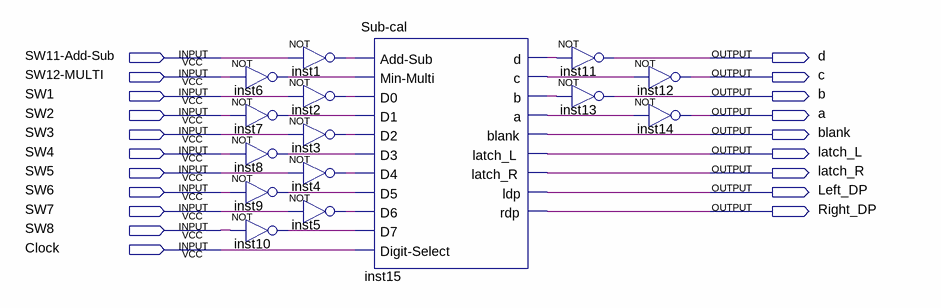
[diagram p0: schematic sheet]
// Quartus schematic Calculator.bdf as structural Verilog: 15 symbols, 20 pins
module Calculator (
  input  \SW11-Add-Sub ,
  input  \SW12-MULTI ,
  input  SW1,
  input  SW2,
  input  SW3,
  input  SW4,
  input  SW5,
  input  SW6,
  input  SW7,
  input  SW8,
  input  Clock,
  output d,
  output c,
  output b,
  output a,
  output blank,
  output latch_L,
  output latch_R,
  output Left_DP,
  output Right_DP
);

  wire inst1_out, inst2_out, inst3_out, inst4_out, inst5_out, inst6_out, inst7_out, inst8_out, inst9_out,
       inst10_out, inst15_a, inst15_b, inst15_c, inst15_d;

  not inst6 (inst6_out, \SW12-MULTI );
  not inst7 (inst7_out, SW2);
  not inst8 (inst8_out, SW4);
  not inst9 (inst9_out, SW6);
  not inst10 (inst10_out, SW8);
  not inst1 (inst1_out, \SW11-Add-Sub );
  not inst2 (inst2_out, SW1);
  not inst3 (inst3_out, SW3);
  not inst4 (inst4_out, SW5);
  not inst5 (inst5_out, SW7);
  \Sub-cal  inst15 (
    .\Add-Sub (inst1_out), .\Min-Multi (inst6_out), .D0(inst2_out), .D1(inst7_out), .D2(inst3_out),
    .D3(inst8_out), .D4(inst4_out), .D5(inst9_out), .D6(inst5_out), .D7(inst10_out), .\Digit-Select (Clock),
    .d(inst15_d), .c(inst15_c), .b(inst15_b), .a(inst15_a), .blank(blank), .latch_L(latch_L),
    .latch_R(latch_R), .ldp(Left_DP), .rdp(Right_DP));
  not inst11 (d, inst15_d);
  not inst13 (b, inst15_b);
  not inst12 (c, inst15_c);
  not inst14 (a, inst15_a);
endmodule
